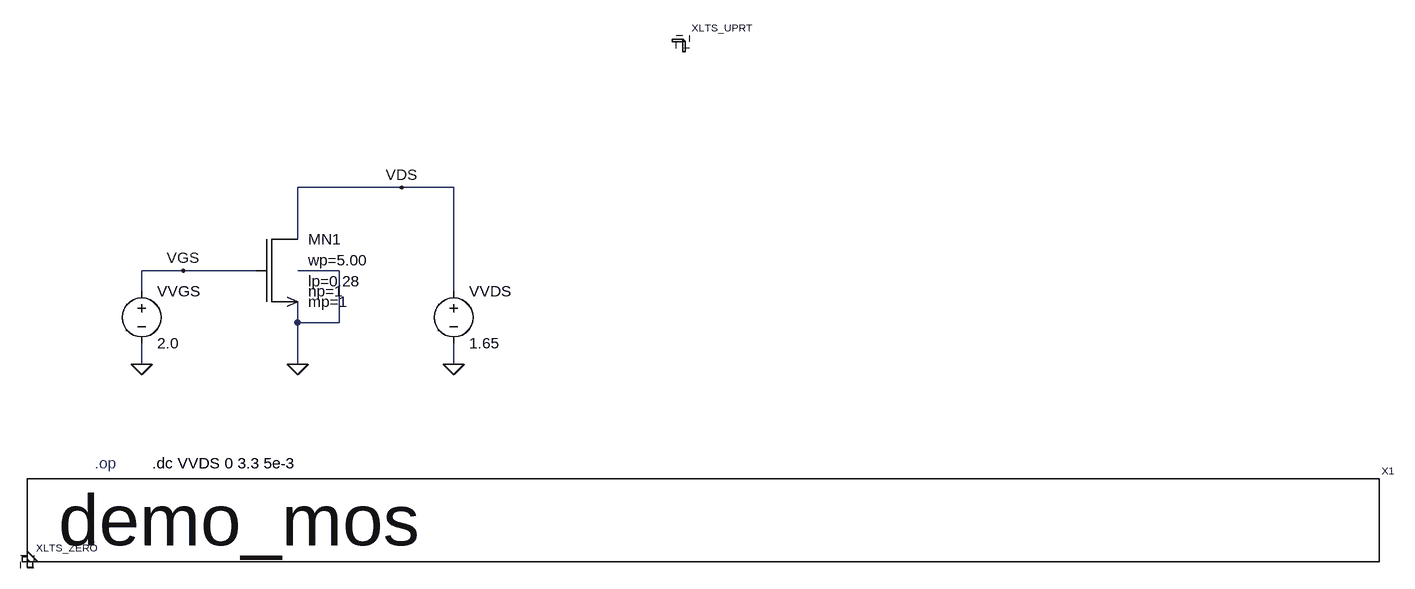
[diagram p0: schematic demo_mos.asc]
demo_mos.asc, the LTspice schematic file:
Version 4.1
SHEET 1 4824 680
WIRE 576 -576 416 -576
WIRE 656 -576 576 -576
WIRE 416 -496 416 -576
WIRE 240 -448 176 -448
WIRE 352 -448 240 -448
WIRE 480 -448 416 -448
WIRE 176 -416 176 -448
WIRE 656 -416 656 -576
WIRE 416 -368 416 -400
WIRE 480 -368 480 -448
WIRE 480 -368 416 -368
WIRE 176 -304 176 -336
WIRE 416 -304 416 -368
WIRE 656 -304 656 -336
FLAG 176 -304 0
FLAG 240 -448 VGS
FLAG 416 -304 0
FLAG 656 -304 0
FLAG 576 -576 VDS
DATAFLAG 496 -576 ""
DATAFLAG 304 -448 ""
DATAFLAG 416 -256 "Ix(MN1:ND)"
DATAFLAG 656 -256 "I(VVDS)"
SYMBOL BD_GTitleLTS 0 0 R0
SYMATTR SpiceModel demo_mos
SYMATTR InstName X1
SYMBOL BD_ZERO 0 0 R0
SYMATTR InstName XLTS_ZERO
SYMBOL BD_UPRT 1008 -800 R0
SYMATTR InstName XLTS_UPRT
SYMBOL gfmcu_nmos3p3 352 -448 R0
SYMATTR InstName MN1
SYMATTR Value wp=5.00
SYMBOL voltage 176 -432 R0
SYMATTR InstName VVGS
SYMATTR Value 2.0
SYMBOL voltage 656 -432 R0
SYMATTR InstName VVDS
SYMATTR Value 1.65
TEXT 104 -152 Left 2 ;.op
TEXT 192 -152 Left 2 !.dc VVDS 0 3.3 5e-3

The netlist it stands for:
* demo_mos.asc
X§X1 BD_GTitleLTS
X§XLTS_ZERO BD_ZERO
X§XLTS_UPRT BD_UPRT
X§MN1 VDS VGS 0 0 gfmcu_nmos3p3 wp=5.00 lp=0.28 np=1 mp=1  ; pins ND NG NS NB
VVGS VGS 0 2.0
VVDS VDS 0 1.65
* .op
.dc VVDS 0 3.3 5e-3
.lib models_gfmcu.lib
.backanno
.end